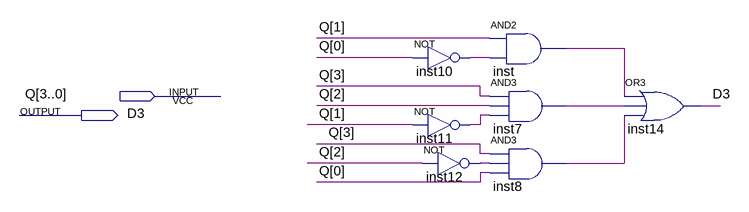
[diagram p0: schematic sheet]
// Quartus schematic d3_logic.bdf as structural Verilog: 7 symbols, 2 pins
module d3_logic (
  input  [3:0] Q,
  output D3
);

  wire inst7_out, inst8_out, inst10_out, inst11_out, inst12_out, inst_out;

  not inst10 (inst10_out, Q[0]);
  not inst11 (inst11_out, Q[1]);
  not inst12 (inst12_out, Q[2]);
  and inst (inst_out, Q[1], inst10_out);
  and inst7 (inst7_out, Q[3], Q[2], inst11_out);
  and inst8 (inst8_out, Q[3], inst12_out, Q[0]);
  or inst14 (D3, inst_out, inst7_out, inst8_out);
endmodule
